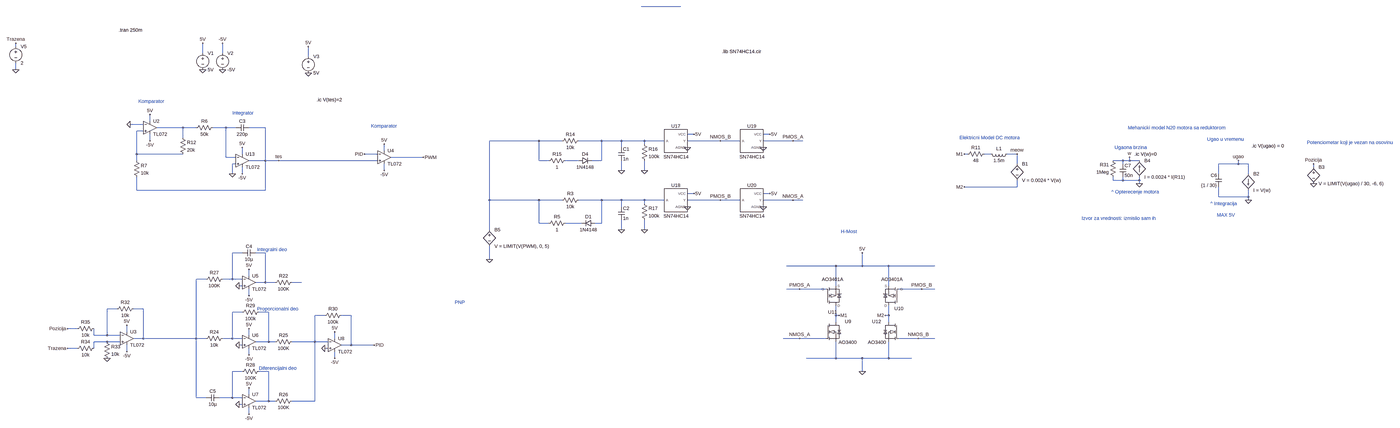
[diagram p0: schematic OP-AMP-OSC-Logicki_2.asc, whole sheet]
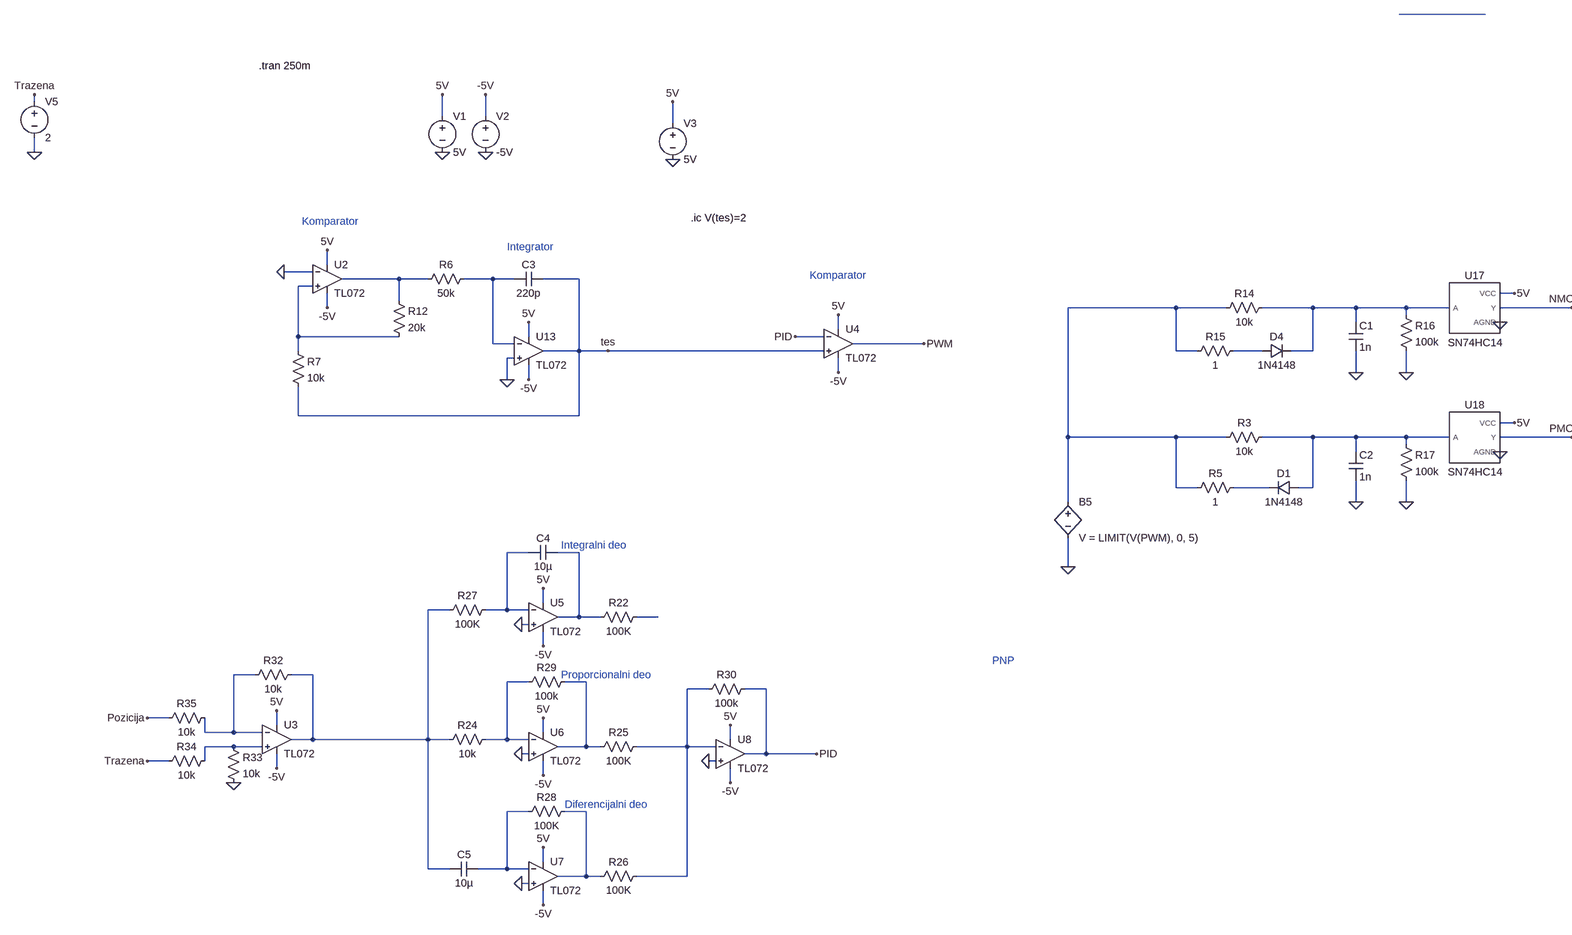
[diagram p1: schematic OP-AMP-OSC-Logicki_2.asc, part, row 1 of 1, column 1 of 2]
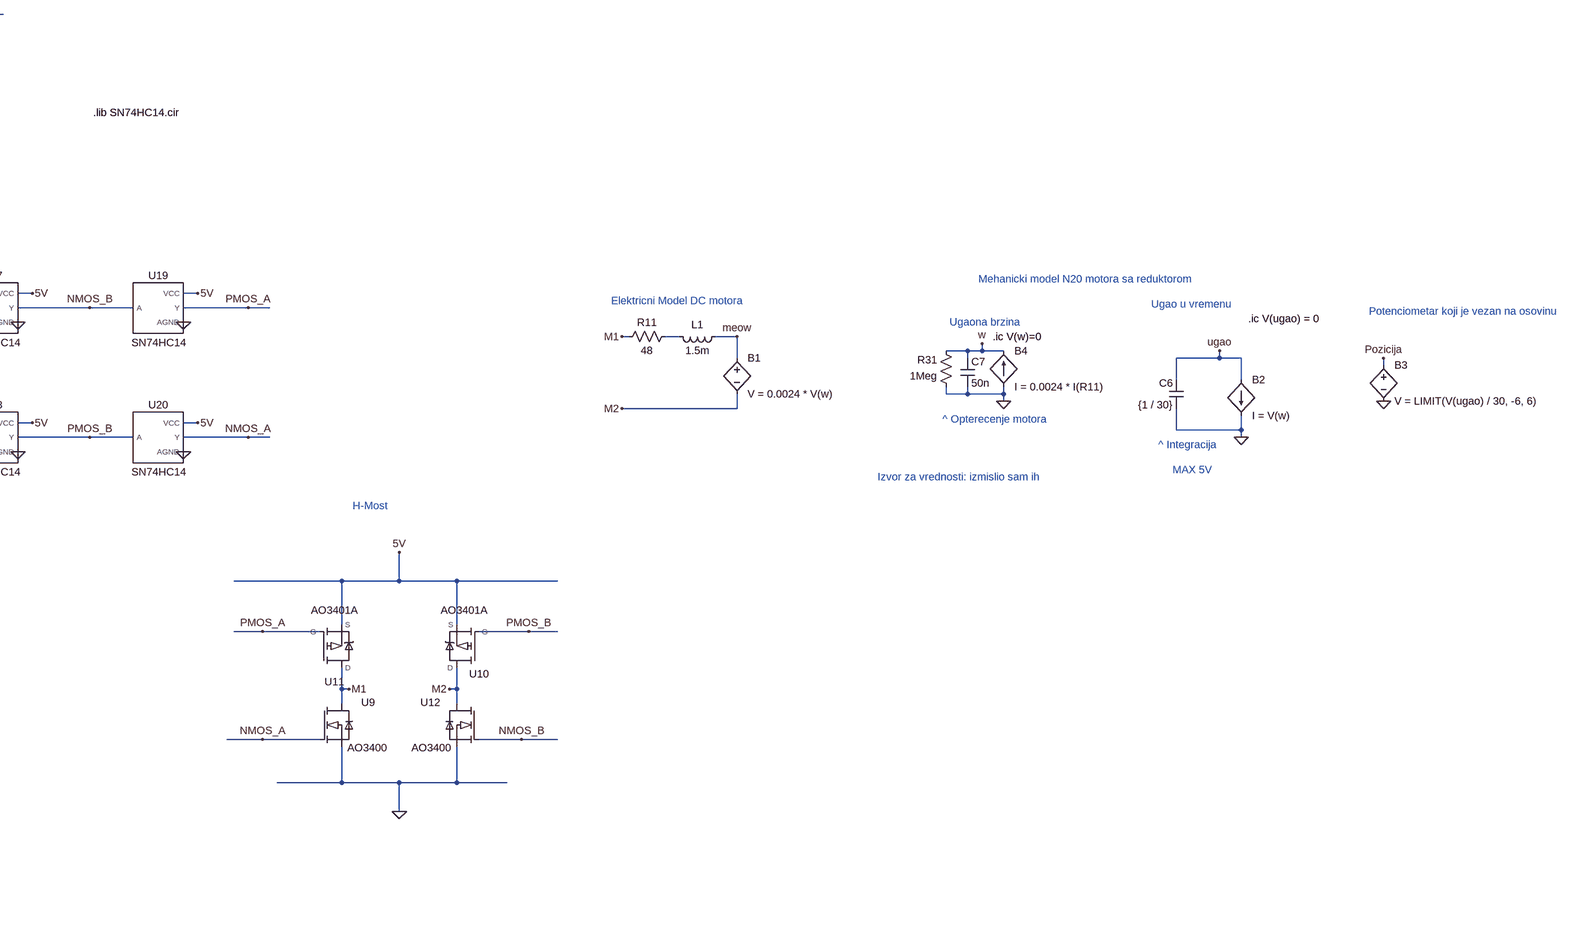
[diagram p2: schematic OP-AMP-OSC-Logicki_2.asc, part, row 1 of 1, column 2 of 2]
OP-AMP-OSC-Logicki_2.asc, the LTspice schematic file:
Version 4
SHEET 1 6380 2180
WIRE 2128 -960 1936 -960
WIRE -1392 -624 -1392 -640
WIRE -272 -592 -272 -640
WIRE -176 -592 -176 -640
WIRE 240 -576 240 -624
WIRE -1392 -512 -1392 -544
WIRE -528 -192 -528 -224
WIRE -560 -176 -624 -176
WIRE -368 -160 -496 -160
WIRE -304 -160 -368 -160
WIRE -160 -160 -224 -160
WIRE -112 -160 -160 -160
WIRE 32 -160 -48 -160
WIRE -560 -144 -592 -144
WIRE 2192 -128 2160 -128
WIRE 2560 -128 2528 -128
WIRE -368 -112 -368 -160
WIRE -528 -96 -528 -128
WIRE 1440 -96 1200 -96
WIRE 1552 -96 1440 -96
WIRE 1744 -96 1632 -96
WIRE 1840 -96 1744 -96
WIRE 1952 -96 1840 -96
WIRE 2048 -96 1952 -96
WIRE 2320 -96 2160 -96
WIRE 2416 -96 2320 -96
WIRE 2672 -96 2528 -96
WIRE 2720 -96 2672 -96
WIRE 1952 -80 1952 -96
WIRE 1840 -64 1840 -96
WIRE 608 -48 608 -80
WIRE -592 -32 -592 -144
WIRE -368 -32 -592 -32
WIRE -80 -32 -80 -64
WIRE 576 -32 512 -32
WIRE 4224 -32 4208 -32
WIRE 4336 -32 4304 -32
WIRE 4464 -32 4416 -32
WIRE -160 -16 -160 -160
WIRE -112 -16 -160 -16
WIRE 880 -16 640 -16
WIRE -592 0 -592 -32
WIRE 32 0 32 -160
WIRE 32 0 -48 0
WIRE 96 0 32 0
WIRE 576 0 96 0
WIRE 1440 0 1440 -96
WIRE 1488 0 1440 0
WIRE 1632 0 1568 0
WIRE 1744 0 1744 -96
WIRE 1744 0 1696 0
WIRE 4992 0 4944 0
WIRE 5024 0 5024 -16
WIRE 5024 0 4992 0
WIRE 5072 0 5024 0
WIRE -112 16 -128 16
WIRE 4464 16 4464 -32
WIRE 4992 16 4992 0
WIRE 5552 16 5552 0
WIRE 5552 16 5456 16
WIRE 5600 16 5552 16
WIRE 5920 32 5920 16
WIRE 608 48 608 16
WIRE 1840 48 1840 0
WIRE 1952 48 1952 0
WIRE -128 64 -128 16
WIRE -80 64 -80 32
WIRE 5456 64 5456 16
WIRE 5600 64 5600 16
WIRE 4944 96 4944 80
WIRE 4992 96 4992 80
WIRE 4992 96 4944 96
WIRE 5072 96 5072 80
WIRE 5072 96 4992 96
WIRE 5072 112 5072 96
WIRE 4464 128 4464 96
WIRE 4464 128 4208 128
WIRE -592 144 -592 80
WIRE 32 144 32 0
WIRE 32 144 -592 144
WIRE 2192 160 2160 160
WIRE 2560 160 2528 160
WIRE 5456 176 5456 128
WIRE 5600 176 5600 144
WIRE 5600 176 5456 176
WIRE 1200 192 1200 -96
WIRE 1440 192 1200 192
WIRE 1552 192 1440 192
WIRE 1744 192 1632 192
WIRE 1840 192 1744 192
WIRE 1952 192 1840 192
WIRE 2048 192 1952 192
WIRE 2320 192 2160 192
WIRE 2416 192 2320 192
WIRE 2672 192 2528 192
WIRE 2720 192 2672 192
WIRE 5600 192 5600 176
WIRE 1952 208 1952 192
WIRE 1840 224 1840 192
WIRE 1440 304 1440 192
WIRE 1488 304 1440 304
WIRE 1648 304 1568 304
WIRE 1744 304 1744 192
WIRE 1744 304 1712 304
WIRE 1200 336 1200 192
WIRE 1840 336 1840 288
WIRE 1952 336 1952 288
WIRE -80 448 -128 448
WIRE 32 448 -16 448
WIRE 1200 480 1200 416
WIRE 2880 512 2640 512
WIRE 3008 512 3008 448
WIRE 3008 512 2880 512
WIRE 3136 512 3008 512
WIRE 3360 512 3136 512
WIRE -48 560 -48 528
WIRE -256 576 -304 576
WIRE -128 576 -128 448
WIRE -128 576 -176 576
WIRE -80 576 -128 576
WIRE 32 592 32 448
WIRE 32 592 -16 592
WIRE 80 592 32 592
WIRE 208 592 160 592
WIRE -80 608 -96 608
WIRE 2880 608 2880 512
WIRE 3136 608 3136 512
WIRE 2704 624 2640 624
WIRE 2832 624 2704 624
WIRE 3296 624 3184 624
WIRE 3360 624 3296 624
WIRE -48 656 -48 624
WIRE -688 720 -736 720
WIRE -560 720 -608 720
WIRE -80 736 -128 736
WIRE 48 736 0 736
WIRE 320 752 272 752
WIRE 448 752 400 752
WIRE 2880 752 2880 704
WIRE 2896 752 2880 752
WIRE 3136 752 3136 704
WIRE 3136 752 3120 752
WIRE 2880 784 2880 752
WIRE 3136 784 3136 752
WIRE -880 816 -928 816
WIRE -640 832 -640 800
WIRE -800 848 -800 816
WIRE -736 848 -736 720
WIRE -736 848 -800 848
WIRE -672 848 -736 848
WIRE -48 848 -48 816
WIRE -560 864 -560 720
WIRE -560 864 -608 864
WIRE -304 864 -304 576
WIRE -304 864 -560 864
WIRE -256 864 -304 864
WIRE -128 864 -128 736
WIRE -128 864 -176 864
WIRE -80 864 -128 864
WIRE 368 864 368 832
WIRE 2704 864 2624 864
WIRE 2832 864 2704 864
WIRE 3280 864 3184 864
WIRE 3360 864 3280 864
WIRE -736 880 -800 880
WIRE -672 880 -736 880
WIRE 48 880 48 736
WIRE 48 880 -16 880
WIRE 80 880 48 880
WIRE 272 880 272 752
WIRE 272 880 160 880
WIRE 336 880 272 880
WIRE -80 896 -96 896
WIRE 448 896 448 752
WIRE 448 896 400 896
WIRE 560 896 448 896
WIRE -880 912 -928 912
WIRE -800 912 -800 880
WIRE 336 912 320 912
WIRE -640 928 -640 896
WIRE -48 944 -48 912
WIRE 368 960 368 928
WIRE 2880 960 2880 880
WIRE 2880 960 2736 960
WIRE 3008 960 2880 960
WIRE 3136 960 3136 880
WIRE 3136 960 3008 960
WIRE 3248 960 3136 960
WIRE -80 1024 -128 1024
WIRE 48 1024 0 1024
WIRE 3008 1024 3008 960
WIRE -48 1136 -48 1104
WIRE -304 1152 -304 864
WIRE -256 1152 -304 1152
WIRE -128 1152 -128 1024
WIRE -128 1152 -192 1152
WIRE -80 1152 -128 1152
WIRE 48 1168 48 1024
WIRE 48 1168 -16 1168
WIRE 80 1168 48 1168
WIRE 272 1168 272 880
WIRE 272 1168 160 1168
WIRE -80 1184 -96 1184
WIRE -48 1232 -48 1200
FLAG -272 -512 0
FLAG -272 -640 5V
FLAG -176 -512 0
FLAG -176 -640 -5V
FLAG 512 -32 PID
FLAG 560 896 PID
FLAG 4208 128 M2
FLAG 4208 -32 M1
FLAG 880 -16 PWM
FLAG 4464 -32 meow
FLAG 5072 112 0
FLAG 5024 -16 w
FLAG 5600 192 0
FLAG 5552 0 ugao
FLAG 5920 112 0
FLAG 5920 16 Pozicija
FLAG -1392 -512 0
FLAG -1392 -640 Trazena
FLAG -928 912 Trazena
FLAG -928 816 Pozicija
FLAG -736 960 0
FLAG 2896 752 M1
FLAG 3120 752 M2
FLAG -128 64 0
FLAG -624 -176 0
FLAG -528 -96 -5V
FLAG -528 -224 5V
FLAG -80 -64 5V
FLAG -80 64 -5V
FLAG 96 0 tes
FLAG -640 928 -5V
FLAG -640 800 5V
FLAG -48 656 -5V
FLAG -48 528 5V
FLAG 368 960 -5V
FLAG 368 832 5V
FLAG -48 944 -5V
FLAG -48 816 5V
FLAG -48 1232 -5V
FLAG -48 1104 5V
FLAG 608 -80 5V
FLAG 608 48 -5V
FLAG -96 896 0
FLAG -96 608 0
FLAG -96 1184 0
FLAG 320 912 0
FLAG 3008 448 5V
FLAG 2192 -128 5V
FLAG 2160 -64 0
FLAG 2192 160 5V
FLAG 2160 224 0
FLAG 2560 -128 5V
FLAG 2528 -64 0
FLAG 2560 160 5V
FLAG 2528 224 0
FLAG 1952 48 0
FLAG 1952 336 0
FLAG 1840 48 0
FLAG 1840 336 0
FLAG 2672 192 NMOS_A
FLAG 2672 -96 PMOS_A
FLAG 2320 -96 NMOS_B
FLAG 2320 192 PMOS_B
FLAG 2704 864 NMOS_A
FLAG 2704 624 PMOS_A
FLAG 3296 624 PMOS_B
FLAG 3280 864 NMOS_B
FLAG 1200 480 0
FLAG 3008 1024 0
FLAG 240 -496 0
FLAG 240 -624 5V
SYMBOL voltage -272 -608 R0
WINDOW 123 0 0 Left 0
WINDOW 39 0 0 Left 0
SYMATTR InstName V1
SYMATTR Value 5V
SYMBOL voltage -176 -608 R0
WINDOW 123 0 0 Left 0
WINDOW 39 0 0 Left 0
SYMATTR InstName V2
SYMATTR Value -5V
SYMBOL res 4320 -48 R90
WINDOW 0 0 56 VBottom 2
WINDOW 3 32 56 VTop 2
SYMATTR InstName R11
SYMATTR Value 48
SYMBOL ind 4432 -48 R90
WINDOW 0 5 56 VBottom 2
WINDOW 3 32 56 VTop 2
SYMATTR InstName L1
SYMATTR Value 1.5m
SYMATTR SpiceLine Rser=1m
SYMBOL res 176 576 R90
WINDOW 0 0 56 VBottom 2
WINDOW 3 32 56 VTop 2
SYMATTR InstName R22
SYMATTR Value 100K
SYMBOL res 176 864 R90
WINDOW 0 0 56 VBottom 2
WINDOW 3 32 56 VTop 2
SYMATTR InstName R25
SYMATTR Value 100K
SYMBOL res 176 1152 R90
WINDOW 0 0 56 VBottom 2
WINDOW 3 32 56 VTop 2
SYMATTR InstName R26
SYMATTR Value 100K
SYMBOL res -160 560 R90
WINDOW 0 0 56 VBottom 2
WINDOW 3 32 56 VTop 2
SYMATTR InstName R27
SYMATTR Value 100K
SYMBOL res -160 848 R90
WINDOW 0 0 56 VBottom 2
WINDOW 3 32 56 VTop 2
SYMATTR InstName R24
SYMATTR Value 10k
SYMBOL res 16 1008 R90
WINDOW 0 0 56 VBottom 2
WINDOW 3 32 56 VTop 2
SYMATTR InstName R28
SYMATTR Value 100K
SYMBOL cap -16 432 R90
WINDOW 0 0 32 VBottom 2
WINDOW 3 32 32 VTop 2
SYMATTR InstName C4
SYMATTR Value 10µ
SYMBOL cap -192 1136 R90
WINDOW 0 0 32 VBottom 2
WINDOW 3 32 32 VTop 2
SYMATTR InstName C5
SYMATTR Value 10µ
SYMBOL res 16 720 R90
WINDOW 0 0 56 VBottom 2
WINDOW 3 32 56 VTop 2
SYMATTR InstName R29
SYMATTR Value 100k
SYMBOL res 416 736 R90
WINDOW 0 0 56 VBottom 2
WINDOW 3 32 56 VTop 2
SYMATTR InstName R30
SYMATTR Value 100k
SYMBOL bv 4464 0 R0
SYMATTR InstName B1
SYMATTR Value V = 0.0024 * V(w)
SYMBOL bi 5072 80 M180
WINDOW 0 24 80 Left 2
WINDOW 3 24 0 Left 2
SYMATTR InstName B4
SYMATTR Value I = 0.0024 * I(R11)
SYMBOL bi 5600 64 R0
SYMATTR InstName B2
SYMATTR Value I = V(w)
SYMBOL cap 5472 64 M0
SYMATTR InstName C6
SYMATTR Value {1 / 30}
SYMBOL cap 4976 16 R0
SYMATTR InstName C7
SYMATTR Value 50n
SYMBOL res 4960 96 R180
WINDOW 0 36 76 Left 2
WINDOW 3 36 40 Left 2
SYMATTR InstName R31
SYMATTR Value 1Meg
SYMBOL bv 5920 16 R0
SYMATTR InstName B3
SYMATTR Value V = LIMIT(V(ugao) / 30, -6, 6)
SYMBOL voltage -1392 -640 R0
WINDOW 123 0 0 Left 0
WINDOW 39 0 0 Left 0
SYMATTR InstName V5
SYMATTR Value 2
SYMBOL res -592 704 R90
WINDOW 0 0 56 VBottom 2
WINDOW 3 32 56 VTop 2
SYMATTR InstName R32
SYMATTR Value 10k
SYMBOL res -752 864 R0
SYMATTR InstName R33
SYMATTR Value 10k
SYMBOL res -784 896 R90
WINDOW 0 0 56 VBottom 2
WINDOW 3 32 56 VTop 2
SYMATTR InstName R34
SYMATTR Value 10k
SYMBOL res -784 800 R90
WINDOW 0 0 56 VBottom 2
WINDOW 3 32 56 VTop 2
SYMATTR InstName R35
SYMATTR Value 10k
SYMBOL AO3400 2912 848 R0
SYMATTR InstName U9
SYMBOL AO3401A 3104 672 R180
WINDOW 0 -82 -31 Bottom 2
SYMATTR InstName U10
SYMBOL AO3401A 2912 672 M180
SYMATTR InstName U11
SYMBOL AO3400 3104 848 M0
SYMATTR InstName U12
SYMBOL res -208 -176 R90
WINDOW 0 0 56 VBottom 2
WINDOW 3 32 56 VTop 2
SYMATTR InstName R6
SYMATTR Value 50k
SYMBOL cap -48 -176 R90
WINDOW 0 0 32 VBottom 2
WINDOW 3 32 32 VTop 2
SYMATTR InstName C3
SYMATTR Value 220p
SYMBOL res -608 -16 R0
SYMATTR InstName R7
SYMATTR Value 10k
SYMBOL res -384 -128 R0
SYMATTR InstName R12
SYMATTR Value 20k
SYMBOL ZZZ\\OpAmp\\TL072 -528 -160 R0
SYMATTR InstName U2
SYMBOL ZZZ\\OpAmp\\TL072 -80 0 R0
SYMATTR InstName U13
SYMBOL ZZZ\\OpAmp\\TL072 608 -16 R0
SYMATTR InstName U4
SYMBOL ZZZ\\OpAmp\\TL072 -640 864 R0
SYMATTR InstName U3
SYMBOL ZZZ\\OpAmp\\TL072 -48 592 R0
SYMATTR InstName U5
SYMBOL ZZZ\\OpAmp\\TL072 -48 880 R0
SYMATTR InstName U6
SYMBOL ZZZ\\OpAmp\\TL072 -48 1168 R0
SYMATTR InstName U7
SYMBOL ZZZ\\OpAmp\\TL072 368 896 R0
SYMATTR InstName U8
SYMBOL res 1648 176 R90
WINDOW 0 0 56 VBottom 2
WINDOW 3 32 56 VTop 2
SYMATTR InstName R3
SYMATTR Value 10k
SYMBOL diode 1712 288 R90
WINDOW 0 0 32 VBottom 2
WINDOW 3 32 32 VTop 2
SYMATTR InstName D1
SYMATTR Value 1N4148
SYMBOL res 1584 288 R90
WINDOW 0 0 56 VBottom 2
WINDOW 3 32 56 VTop 2
SYMATTR InstName R5
SYMATTR Value 1
SYMBOL res 1648 -112 R90
WINDOW 0 0 56 VBottom 2
WINDOW 3 32 56 VTop 2
SYMATTR InstName R14
SYMATTR Value 10k
SYMBOL diode 1632 16 R270
WINDOW 0 32 32 VTop 2
WINDOW 3 0 32 VBottom 2
SYMATTR InstName D4
SYMATTR Value 1N4148
SYMBOL res 1584 -16 R90
WINDOW 0 0 56 VBottom 2
WINDOW 3 32 56 VTop 2
SYMATTR InstName R15
SYMATTR Value 1
SYMBOL SN74HC14 2096 -112 R0
WINDOW 3 9 78 Top 2
SYMATTR InstName U17
SYMBOL SN74HC14 2096 176 R0
WINDOW 3 9 78 Top 2
SYMATTR InstName U18
SYMBOL SN74HC14 2464 -112 R0
WINDOW 3 9 78 Top 2
SYMATTR InstName U19
SYMBOL SN74HC14 2464 176 R0
WINDOW 3 9 78 Top 2
SYMATTR InstName U20
SYMBOL res 1936 -96 R0
SYMATTR InstName R16
SYMATTR Value 100k
SYMBOL res 1936 192 R0
SYMATTR InstName R17
SYMATTR Value 100k
SYMBOL cap 1824 -64 R0
SYMATTR InstName C1
SYMATTR Value 1n
SYMBOL cap 1824 224 R0
SYMATTR InstName C2
SYMATTR Value 1n
SYMBOL bv 1200 320 R0
SYMATTR InstName B5
SYMATTR Value V = LIMIT(V(PWM), 0, 5)
SYMBOL voltage 240 -592 R0
WINDOW 123 0 0 Left 0
WINDOW 39 0 0 Left 0
SYMATTR InstName V3
SYMATTR Value 5V
TEXT -680 -704 Left 2 !.tran 250m
TEXT 544 -168 Left 2 ;Komparator
TEXT 1032 688 Left 2 ;PNP
TEXT -8 432 Left 2 ;Integralni deo
TEXT -8 720 Left 2 ;Proporcionalni deo
TEXT 0 1008 Left 2 ;Diferencijalni deo
TEXT 4184 -112 Left 2 ;Elektricni Model DC motora
TEXT 5616 -72 Left 2 !.ic V(ugao) = 0
TEXT 4952 -64 Left 2 ;Ugaona brzina
TEXT 4936 152 Left 2 ;^ Opterecenje motora
TEXT 5400 -104 Left 2 ;Ugao u vremenu
TEXT 5416 208 Left 2 ;^ Integracija
TEXT 5048 -32 Left 2 !.ic V(w)=0
TEXT 5016 -160 Left 2 ;Mehanicki model N20 motora sa reduktorom
TEXT 4792 280 Left 2 ;Izvor za vrednosti: izmislio sam ih
TEXT 5888 -88 Left 2 ;Potenciometar koji je vezan na osovinu
TEXT 2904 344 Left 2 ;H-Most
TEXT 5448 264 Left 2 ;MAX 5V
TEXT 280 -296 Left 2 !.ic V(tes)=2
TEXT -128 -232 Left 2 ;Integrator
TEXT -584 -288 Left 2 ;Komparator
TEXT 2328 -600 Left 2 !.lib SN74HC14.cir

The netlist it stands for:
* OP-AMP-OSC-Logicki_2.asc
V1 5V 0 5V
V2 -5V 0 -5V
R11 N007 M1 48
L1 meow N007 1.5m Rser=1m
R22 N014 N012 100K
R25 N018 N017 100K
R26 N018 N021 100K
R27 N011 N013 100K
R24 N016 N013 10k
R28 N021 N020 100K
C4 N012 N011 10µ
C5 N020 N013 10µ
R29 N017 N016 100k
R30 PID N018 100k
B1 meow M2 V = 0.0024 * V(w)
B4 0 w I = 0.0024 * I(R11)
B2 ugao 0 I = V(w)
C6 ugao 0 {1 / 30}
C7 w 0 50n
R31 0 w 1Meg
B3 Pozicija 0 V = LIMIT(V(ugao) / 30, -6, 6)
V5 Trazena 0 2
R32 N013 N015 10k
R33 N019 0 10k
R34 N019 Trazena 10k
R35 N015 Pozicija 10k
XU9 M1 NMOS_A 0 AO3400  ; pins 1 4 2
XU10 M2 PMOS_B 5V AO3401A  ; pins D G S
XU11 M1 PMOS_A 5V AO3401A  ; pins D G S
XU12 M2 NMOS_B 0 AO3400  ; pins 1 4 2
R6 N003 N002 50k
C3 tes N003 220p
R7 N004 tes 10k
R12 N002 N004 20k
* U2: TL072 (symbol ZZZ\OpAmp\TL072 not available, pins judged from their places): In+=N004 In-=0 V+=5V V-=-5V OUT=N002
* U13: TL072 (symbol ZZZ\OpAmp\TL072 not available, pins judged from their places): In+=0 In-=N003 V+=5V V-=-5V OUT=tes
* U4: TL072 (symbol ZZZ\OpAmp\TL072 not available, pins judged from their places): In+=tes In-=PID V+=5V V-=-5V OUT=PWM
* U3: TL072 (symbol ZZZ\OpAmp\TL072 not available, pins judged from their places): In+=N019 In-=N015 V+=5V V-=-5V OUT=N013
* U5: TL072 (symbol ZZZ\OpAmp\TL072 not available, pins judged from their places): In+=0 In-=N011 V+=5V V-=-5V OUT=N012
* U6: TL072 (symbol ZZZ\OpAmp\TL072 not available, pins judged from their places): In+=0 In-=N016 V+=5V V-=-5V OUT=N017
* U7: TL072 (symbol ZZZ\OpAmp\TL072 not available, pins judged from their places): In+=0 In-=N020 V+=5V V-=-5V OUT=N021
* U8: TL072 (symbol ZZZ\OpAmp\TL072 not available, pins judged from their places): In+=0 In-=N018 V+=5V V-=-5V OUT=PID
R3 N009 N005 10k
D1 N009 N010 1N4148
R5 N010 N005 1
R14 N006 N005 10k
D4 N008 N006 1N4148
R15 N008 N005 1
XU17 NMOS_B N006 5V 0 SN74HC14  ; pins Y A VCC AGND
XU18 PMOS_B N009 5V 0 SN74HC14  ; pins Y A VCC AGND
XU19 PMOS_A NMOS_B 5V 0 SN74HC14  ; pins Y A VCC AGND
XU20 NMOS_A PMOS_B 5V 0 SN74HC14  ; pins Y A VCC AGND
R16 N006 0 100k
R17 N009 0 100k
C1 N006 0 1n
C2 N009 0 1n
B5 N005 0 V = LIMIT(V(PWM), 0, 5)
V3 5V 0 5V
.model D D
.lib standard.dio
.tran 250m
* Komparator
* PNP
* Integralni deo
* Proporcionalni deo
* Diferencijalni deo
* Elektricni Model DC motora
.ic V(ugao) = 0
* Ugaona brzina
* ^ Opterecenje motora
* Ugao u vremenu
* ^ Integracija
.ic V(w)=0
* Mehanicki model N20 motora sa reduktorom
* Izvor za vrednosti: izmislio sam ih
* Potenciometar koji je vezan na osovinu
* H-Most
* MAX 5V
.ic V(tes)=2
* Integrator
* Komparator
.lib SN74HC14.cir
.lib AO3400.mod
.lib AO3401A.mod
.lib SN74HC14.cir
.backanno
.end